# Altium schematic sheet Control_Board.SchDoc
size A4; SheetNumber: 1; SheetTotal: 2
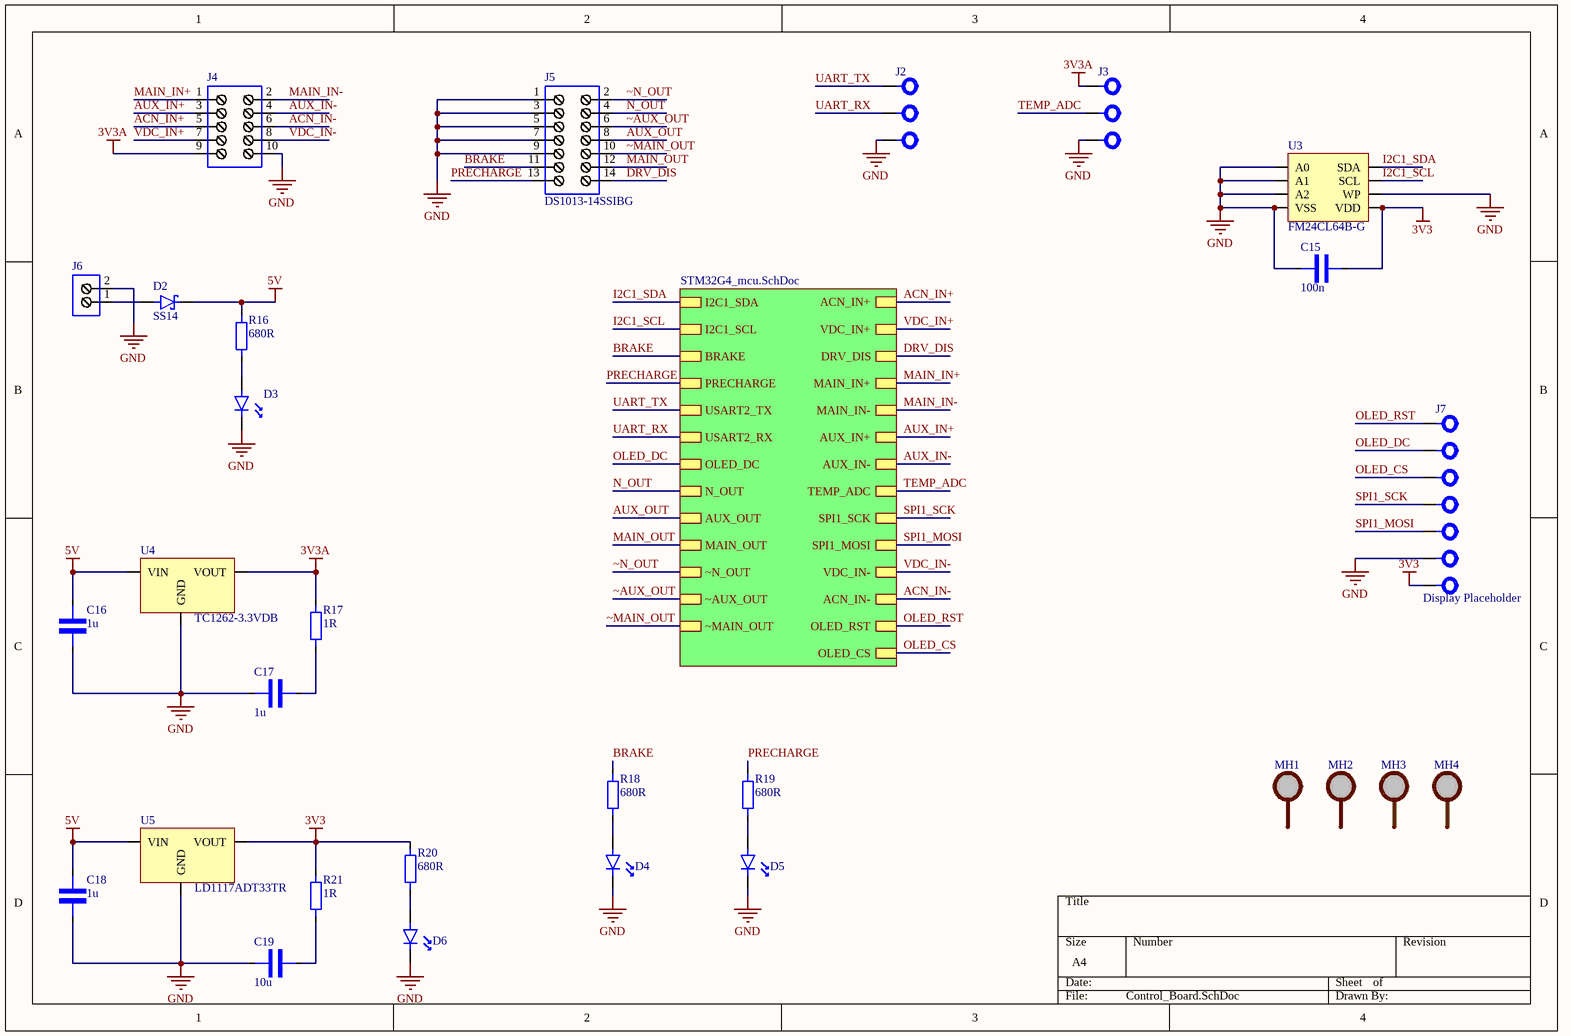
[diagram p0: Control_Board.SchDoc]

## Parts
C15  100n  [CAPACITOR_0603]
C16  1u  [Capacitor_0805]
C17  1u  [Capacitor_0805]
C18  1u  [Capacitor_0805]
C19  10u  [Capacitor_0805]
D2  SS14  [DIOM5226X230N]
D3  LTST-C171KRKT  [LTST-C171K]  (value not drawn)
D4  LTST-C171KRKT  [LTST-C171K]  (value not drawn)
D5  LTST-C171KRKT  [LTST-C171K]  (value not drawn)
D6  LTST-C171KRKT  [LTST-C171K]  (value not drawn)
J2  Goldpin_3pin  [Goldpin_3pin]  (value not drawn)
J3  Goldpin_3pin  [Goldpin_3pin]  (value not drawn)
J4  DS1013-10SSIB1-B-0  [DS1013-10SSIB1-B-0]  (value not drawn)
J5  DS1013-14SSIBG  [DS1013-14SSIBG]
J6  JST_B2B-XH-A_(LF)(SN)  [JST_B2B-XH-A_(LF)(SN)]  (value not drawn)
J7  Display Placeholder  [Waveshare_25512]
MH1  Mounting Hole  [M3 mounting hole]  (value not drawn)
MH2  Mounting Hole  [M3 mounting hole]  (value not drawn)
MH3  Mounting Hole  [M3 mounting hole]  (value not drawn)
MH4  Mounting Hole  [M3 mounting hole]  (value not drawn)
R16  680R  [RESISTOR_0805]
R17  1R  [RESISTOR_0603]
R18  680R  [RESISTOR_0805]
R19  680R  [RESISTOR_0805]
R20  680R  [RESISTOR_0805]
R21  1R  [RESISTOR_0603]
U3  FM24CL64B-G  [FM24CL64B-G]
U4  TC1262-3.3VDB  [TC1262-3.3VDB]
U5  LD1117ADT33TR  [LD1117ADT33TR]

## Sub-sheets
U_STM32G4_mcu = STM32G4_mcu.SchDoc: I2C1_SDA, I2C1_SCL, BRAKE, PRECHARGE, USART2_TX, USART2_RX, OLED_DC, N_OUT, AUX_OUT, MAIN_OUT, ~N_OUT, ~AUX_OUT, ~MAIN_OUT, ACN_IN+, VDC_IN+, DRV_DIS, MAIN_IN+, MAIN_IN-, AUX_IN+, AUX_IN-, TEMP_ADC, SPI1_SCK, SPI1_MOSI, VDC_IN-, ACN_IN-, OLED_RST, OLED_CS

## Nets
3V3: C15.2 J7.7(VCC) R20.1 R21.2 U3.5(VDD) U5.2(VOUT)
3V3A: J3.1 J4.9 R17.2 U4.3(VOUT)
5V: C16.2 C18.2 D2.2(K) R16.2 U4.1(VIN) U5.3(VIN)
GND: C15.1 C16.1 C17.2 C18.1 C19.2 D3.2(K) D4.2(K) D5.2(K) D6.2(K) J2.3 J3.3 J4.10 J5.1 J5.3 J5.5 J5.7 J5.9 J6.2 J7.6(GND) U3.1(A0) U3.2(A1) U3.3(A2) U3.4(VSS) U3.6(WP) U4.2(GND) U5.1(GND)
ACN_IN+: J4.5 ; sheet U_STM32G4_mcu/ACN_IN+
ACN_IN-: J4.6 ; sheet U_STM32G4_mcu/ACN_IN-
AUX_IN+: J4.3 ; sheet U_STM32G4_mcu/AUX_IN+
AUX_IN-: J4.4 ; sheet U_STM32G4_mcu/AUX_IN-
AUX_OUT: J5.8 ; sheet U_STM32G4_mcu/AUX_OUT
BRAKE: J5.11 R18.1 ; sheet U_STM32G4_mcu/BRAKE
DRV_DIS: J5.14 ; sheet U_STM32G4_mcu/DRV_DIS
I2C1_SCL: U3.7(SCL) ; sheet U_STM32G4_mcu/I2C1_SCL
I2C1_SDA: U3.8(SDA) ; sheet U_STM32G4_mcu/I2C1_SDA
MAIN_IN+: J4.1 ; sheet U_STM32G4_mcu/MAIN_IN+
MAIN_IN-: J4.2 ; sheet U_STM32G4_mcu/MAIN_IN-
MAIN_OUT: J5.12 ; sheet U_STM32G4_mcu/MAIN_OUT
N_OUT: J5.4 ; sheet U_STM32G4_mcu/N_OUT
OLED_CS: J7.3(CS) ; sheet U_STM32G4_mcu/OLED_CS
OLED_DC: J7.2(DC) ; sheet U_STM32G4_mcu/OLED_DC
OLED_RST: J7.1(RST) ; sheet U_STM32G4_mcu/OLED_RST
PRECHARGE: J5.13 R19.1 ; sheet U_STM32G4_mcu/PRECHARGE
SPI1_MOSI: J7.5(DIN) ; sheet U_STM32G4_mcu/SPI1_MOSI
SPI1_SCK: J7.4(CLK) ; sheet U_STM32G4_mcu/SPI1_SCK
TEMP_ADC: J3.2 ; sheet U_STM32G4_mcu/TEMP_ADC
UART_RX: J2.2 ; sheet U_STM32G4_mcu/USART2_RX
UART_TX: J2.1 ; sheet U_STM32G4_mcu/USART2_TX
VDC_IN+: J4.7 ; sheet U_STM32G4_mcu/VDC_IN+
VDC_IN-: J4.8 ; sheet U_STM32G4_mcu/VDC_IN-
~AUX_OUT: J5.6 ; sheet U_STM32G4_mcu/~AUX_OUT
~MAIN_OUT: J5.10 ; sheet U_STM32G4_mcu/~MAIN_OUT
~N_OUT: J5.2 ; sheet U_STM32G4_mcu/~N_OUT
NetC17_1: C17.1 R17.1
NetC19_1: C19.1 R21.1
NetD2_1: D2.1(A) J6.1
NetD3_1: D3.1(A) R16.1
NetD4_1: D4.1(A) R18.2
NetD5_1: D5.1(A) R19.2
NetD6_1: D6.1(A) R20.2

## Library data of the parts
C15 = CAPACITOR_0603: MLCC capacitor in 0603 package
C16-C19 = CAPACITOR_0805: MLCC capacitor in 0805 package
D2 = SS14: 1A, 40V, Schottky Rectifier; MF: Taiwan Semiconductor; SnapEDA_Link: https://www.snapeda.com/parts/SS14/taiwan/view-part/?ref=snap; Package: SMA-2 Taiwan Semiconductor; MP: SS14; Check_prices: https://www.snapeda.com/parts/SS14/taiwan/view-part/?ref=eda
D3-D6 = LTST-C171KRKT: LED; red; SMD; 0805; 18÷54mcd; 2÷2.4VDC; 2x1.25x0.8mm; 130°; 20mA
J2 J3 = Goldpin_3pin: goldpin 3 pin connector
J4 = DS1013-10SSIB1-B-0: Connector: IDC; socket; male; PIN: 10; straight; THT; 2.54mm; 2x5
J5 = DS1013-14SSIBG: Connector: IDC; socket; male; data; PIN: 14; straight; THT; 2.54mm
J6 = JST_B2B-XH-A_(LF)(SN): Connector: wire-board; XH; socket; male; data; 3A; 250V; PIN: 2; 2.5mm
J7 = Waveshare_25512: Waveshare 25512 128x64 OLED display placeholder
MH1-MH4 = M3_mounting_hole
R16 R18-R20 = RESISTOR_0805: SMD resistor in 0805 package
R17 R21 = RESISTOR_0603: SMD resistor in 0603 package
U3 = FM24CL64B-G: IC: FRAM memory; 64kbFRAM; I2C; 8kx8bit; 2.7÷3.6VDC; 1MHz; SO8
U4 = TC1262-3.3VDB: LDO Voltage Regulators 500mA Fixed Output CMOS; pin to pad: 2>2+4
U5 = LD1117ADT33TR: IC: voltage regulator; LDO,linear,fixed; 3.3V; 1A; DPAK; SMD; ±4%